# Altium project Knob-PCB-v1.0.PrjPcb (part 1 of 2)
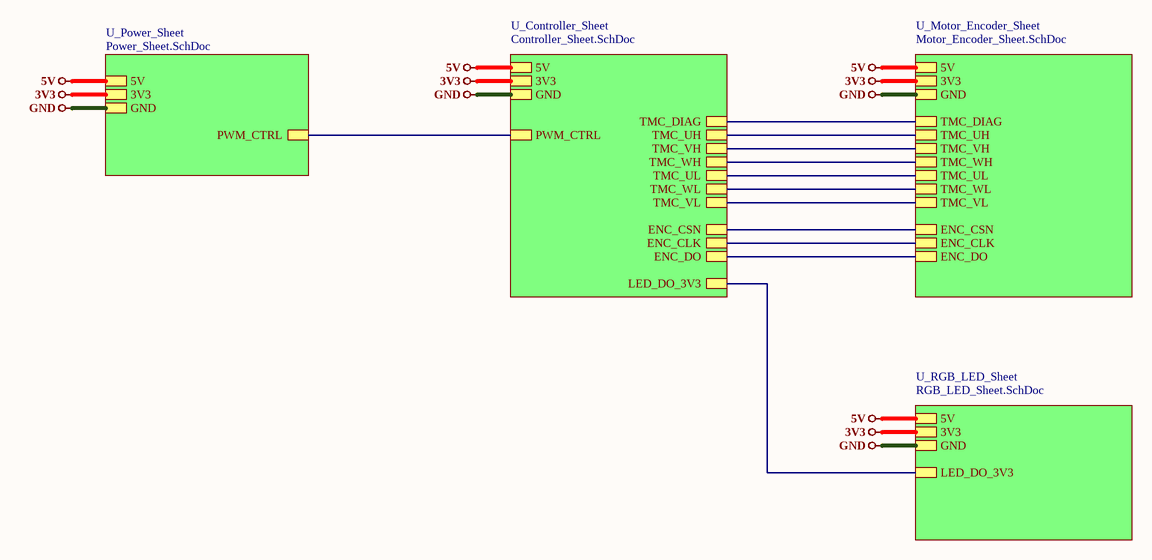
[diagram p0: Top_Sheet.SchDoc]
5 sheets, 109 parts. Net scope: hierarchical (ports join the sheet entries above them; power ports are global).
Board file: Knob-v1.0.PcbDoc
Sheets:
  Top_Sheet.SchDoc
    U_Controller_Sheet = Controller_Sheet.SchDoc
    U_Power_Sheet = Power_Sheet.SchDoc
    U_Motor_Encoder_Sheet = Motor_Encoder_Sheet.SchDoc
    U_RGB_LED_Sheet = RGB_LED_Sheet.SchDoc

## Sheet Top_Sheet.SchDoc
size 420 x 297 mm; SheetNumber: 1; SheetTotal: 5

### Sub-sheets
U_Controller_Sheet = Controller_Sheet.SchDoc: 3V3, GND, 5V, TMC_UH, TMC_VH, TMC_WH, TMC_UL, TMC_WL, TMC_VL, ENC_CSN, ENC_CLK, ENC_DO, TMC_DIAG, PWM_CTRL, LED_DO_3V3
U_Motor_Encoder_Sheet = Motor_Encoder_Sheet.SchDoc: 3V3, GND, 5V, TMC_UH, TMC_VH, TMC_WH, TMC_UL, TMC_WL, TMC_VL, ENC_CSN, ENC_CLK, ENC_DO, TMC_DIAG
U_Power_Sheet = Power_Sheet.SchDoc: 3V3, GND, 5V, PWM_CTRL
U_RGB_LED_Sheet = RGB_LED_Sheet.SchDoc: 3V3, GND, 5V, LED_DO_3V3

### Nets
3V3: sheet U_Controller_Sheet/3V3, sheet U_Power_Sheet/3V3, sheet U_Motor_Encoder_Sheet/3V3, sheet U_RGB_LED_Sheet/3V3
5V: sheet U_Controller_Sheet/5V, sheet U_Power_Sheet/5V, sheet U_Motor_Encoder_Sheet/5V, sheet U_RGB_LED_Sheet/5V
GND: sheet U_Controller_Sheet/GND, sheet U_Power_Sheet/GND, sheet U_Motor_Encoder_Sheet/GND, sheet U_RGB_LED_Sheet/GND
ENC_CLK: sheet U_Controller_Sheet/ENC_CLK, sheet U_Motor_Encoder_Sheet/ENC_CLK
ENC_CSN: sheet U_Controller_Sheet/ENC_CSN, sheet U_Motor_Encoder_Sheet/ENC_CSN
ENC_DO: sheet U_Controller_Sheet/ENC_DO, sheet U_Motor_Encoder_Sheet/ENC_DO
LED_DO_3V3: sheet U_Controller_Sheet/LED_DO_3V3, sheet U_RGB_LED_Sheet/LED_DO_3V3
PWM_CTRL: sheet U_Controller_Sheet/PWM_CTRL, sheet U_Power_Sheet/PWM_CTRL
TMC_DIAG: sheet U_Controller_Sheet/TMC_DIAG, sheet U_Motor_Encoder_Sheet/TMC_DIAG
TMC_UH: sheet U_Controller_Sheet/TMC_UH, sheet U_Motor_Encoder_Sheet/TMC_UH
TMC_UL: sheet U_Controller_Sheet/TMC_UL, sheet U_Motor_Encoder_Sheet/TMC_UL
TMC_VH: sheet U_Controller_Sheet/TMC_VH, sheet U_Motor_Encoder_Sheet/TMC_VH
TMC_VL: sheet U_Controller_Sheet/TMC_VL, sheet U_Motor_Encoder_Sheet/TMC_VL
TMC_WH: sheet U_Controller_Sheet/TMC_WH, sheet U_Motor_Encoder_Sheet/TMC_WH
TMC_WL: sheet U_Controller_Sheet/TMC_WL, sheet U_Motor_Encoder_Sheet/TMC_WL

### Notes on the sheet
- File:
- Title:
- Date:
- Page
- Num:
- Total:
- Drawn By: Huzaifa Ali

## Sheet Controller_Sheet.SchDoc
size 420 x 297 mm; SheetNumber: 3; SheetTotal: 5
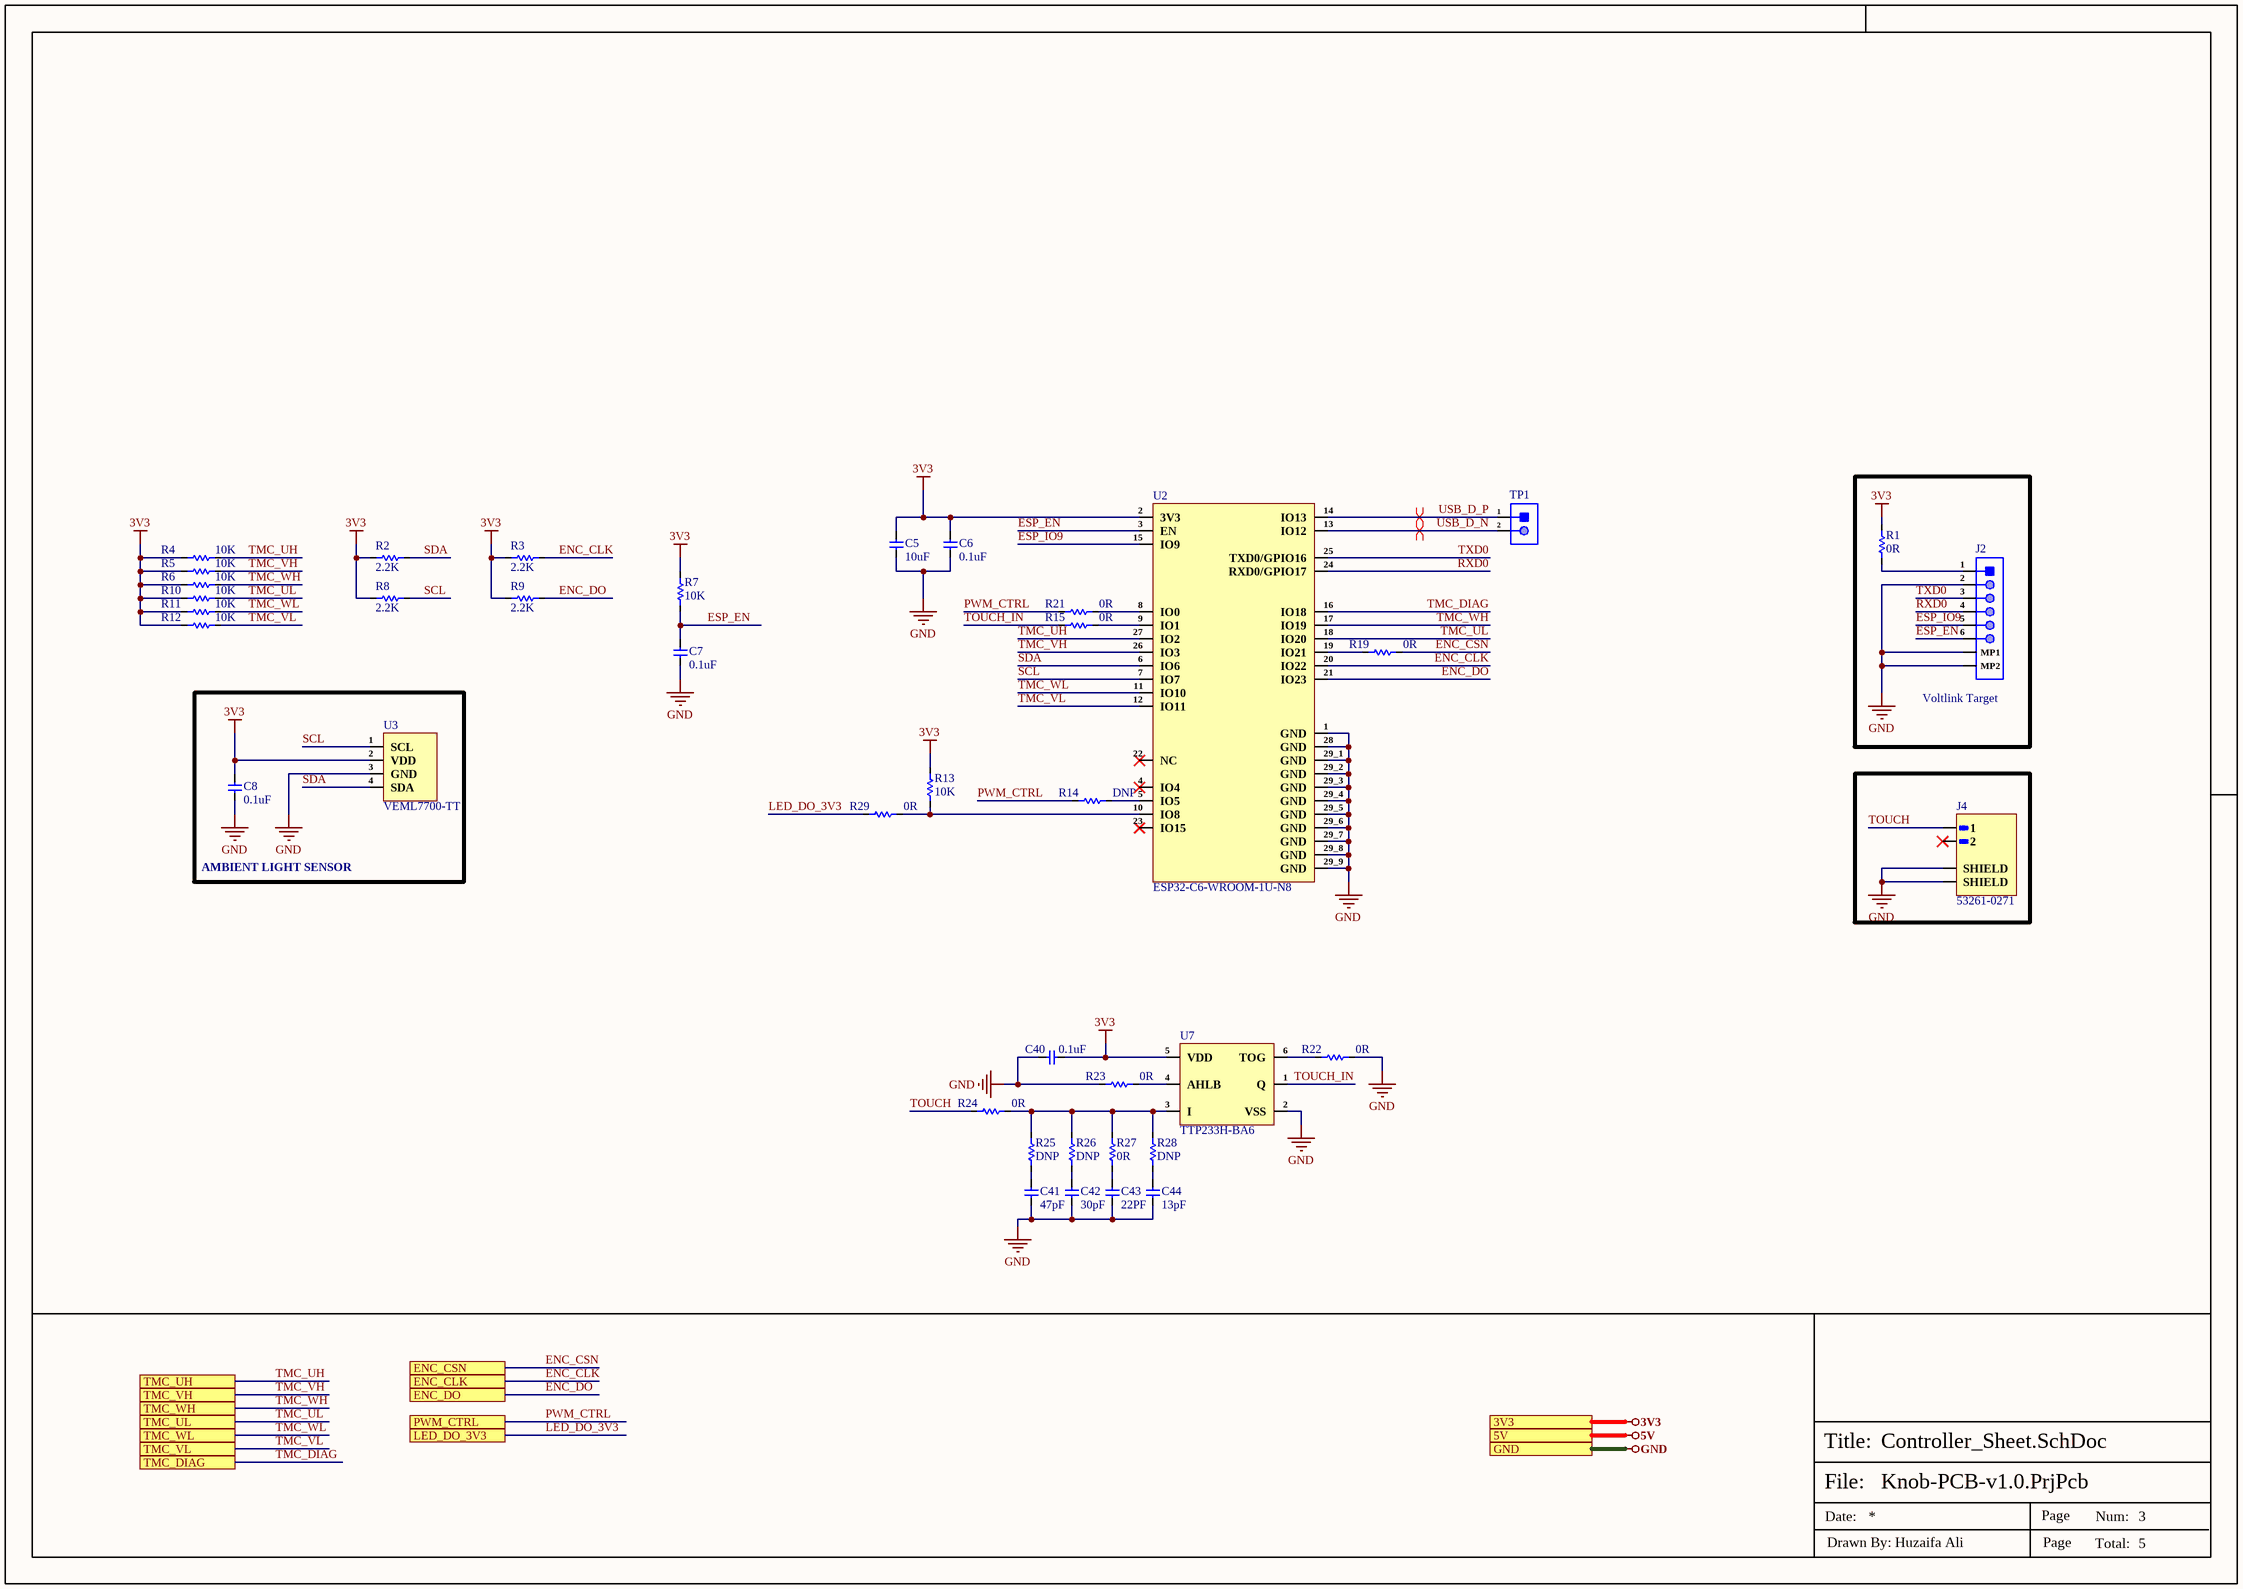
[diagram p1: Controller_Sheet.SchDoc]

### Parts
C5  10uF  [Cap-0805]
C6  0.1uF  [Cap-0402]
C7  0.1uF  [Cap-0402]
C8  0.1uF  [Cap-0402]
C40  0.1uF  [Cap-0402]
C41  47pF  [Cap-0402]
C42  30pF  [Cap-0402]
C43  22PF  [Cap-0402]
C44  13pF  [Cap-0402]
J2  Voltlink Target  [Voltlink Target]
J4  53261-0271  [0532610271]
R1  0R  [Res-0603]
R2  2.2K  [Res-0603]
R3  2.2K  [Res-0603]
R4  10K  [Res-0402]
R5  10K  [Res-0402]
R6  10K  [Res-0402]
R7  10K  [Res-0402]
R8  2.2K  [Res-0603]
R9  2.2K  [Res-0603]
R10  10K  [Res-0402]
R11  10K  [Res-0402]
R12  10K  [Res-0402]
R13  10K  [Res-0402]
R14  DNP  [Res-0603]
R15  0R  [Res-0603]
R19  0R  [Res-0603]
R21  0R  [Res-0603]
R22  0R  [Res-0603]
R23  0R  [Res-0603]
R24  0R  [Res-0603]
R25  DNP  [Res-0603]  (no BOM)
R26  DNP  [Res-0603]  (no BOM)
R27  0R  [Res-0603]
R28  DNP  [Res-0603]  (no BOM)
R29  0R  [Res-0603]
TP1  2 Test Pad  [2 Test Pad]  (value not drawn)  (no BOM)
U2  ESP32-C6-WROOM-1U-N8  [ESP32-C6-WROOM-1U-N8]
U3  VEML7700-TT  [VEML7700-TT]
U7  TTP233H-BA6  [SOT-23-6]

### Blocks framed on the sheet
AMBIENT LIGHT SENSOR: C8 U3

### Ports
3V3 (see Top_Sheet[3B], Motor_Encoder_Sheet[4D], Power_Sheet[3D], RGB_LED_Sheet[4D]), 5V (see Top_Sheet[3B], Motor_Encoder_Sheet[4D], Power_Sheet[3D], RGB_LED_Sheet[4D]), ENC_CLK (see Top_Sheet[4C], Motor_Encoder_Sheet[2D]), ENC_CSN (see Top_Sheet[4C], Motor_Encoder_Sheet[2D]), ENC_DO (see Top_Sheet[4C], Motor_Encoder_Sheet[2D]), GND (see Top_Sheet[3B], Motor_Encoder_Sheet[4D], Power_Sheet[3D], RGB_LED_Sheet[4D]), LED_DO_3V3 (see Top_Sheet[4C], RGB_LED_Sheet[1D]), PWM_CTRL (see Top_Sheet[3B], Power_Sheet[1D]), TMC_DIAG (see Top_Sheet[4B], Motor_Encoder_Sheet[1D]), TMC_UH (see Top_Sheet[4B], Motor_Encoder_Sheet[1D]), TMC_UL (see Top_Sheet[4C], Motor_Encoder_Sheet[1D]), TMC_VH (see Top_Sheet[4B], Motor_Encoder_Sheet[1D]), TMC_VL (see Top_Sheet[4C], Motor_Encoder_Sheet[1D]), TMC_WH (see Top_Sheet[4C], Motor_Encoder_Sheet[1D]), TMC_WL (see Top_Sheet[4C], Motor_Encoder_Sheet[1D])

### Nets
3V3: C5.2 C6.2 C8.2 C40.1 R1.2 R2.2 R3.2 R4.1 R5.1 R6.1 R7.2 R8.2 R9.2 R10.1 R11.1 R12.1 R13.2 U2.2(3V3) U3.2(VDD) U7.5(VDD) ; port 3V3
GND: C5.1 C6.1 C7.1 C8.1 C40.2 C41.1 C42.1 C43.1 C44.1 J2.2 J2.MP1 J2.MP2 J4.SH1(SHIELD) J4.SH2(SHIELD) R22.2 R23.1 U2.1(GND) U2.28(GND) U2.29_1(GND) U2.29_2(GND) U2.29_3(GND) U2.29_4(GND) U2.29_5(GND) U2.29_6(GND) U2.29_7(GND) U2.29_8(GND) U2.29_9(GND) U3.3(GND) U7.2(VSS) ; port GND
ENC_CLK: R3.1 U2.20(IO22) ; port ENC_CLK
ENC_CSN: R19.2 ; port ENC_CSN
ENC_DO: R9.1 U2.21(IO23) ; port ENC_DO
ESP_EN: C7.2 J2.6 R7.1 U2.3(EN)
ESP_IO9: J2.5 U2.15(IO9)
LED_DO_3V3: R29.1 ; port LED_DO_3V3
PWM_CTRL: R14.1 R21.1 ; port PWM_CTRL
RXD0: J2.4 U2.24(RXD0/GPIO17)
SCL: R8.1 U2.7(IO7) U3.1(SCL)
SDA: R2.1 U2.6(IO6) U3.4(SDA)
TMC_DIAG: U2.16(IO18) ; port TMC_DIAG
TMC_UH: R4.2 U2.27(IO2) ; port TMC_UH
TMC_UL: R10.2 U2.18(IO20) ; port TMC_UL
TMC_VH: R5.2 U2.26(IO3) ; port TMC_VH
TMC_VL: R12.2 U2.12(IO11) ; port TMC_VL
TMC_WH: R6.2 U2.17(IO19) ; port TMC_WH
TMC_WL: R11.2 U2.11(IO10) ; port TMC_WL
TOUCH: J4.1 R24.1
TOUCH_IN: R15.1 U7.1(Q)
TXD0: J2.3 U2.25(TXD0/GPIO16)
USB_D_N: TP1.2 U2.13(IO12)
USB_D_P: TP1.1 U2.14(IO13)
NetC41_2: C41.2 R25.1
NetC42_2: C42.2 R26.1
NetC43_2: C43.2 R27.1
NetC44_2: C44.2 R28.1
NetJ2_1: J2.1 R1.1
NetR13_1: R13.1 R29.2 U2.10(IO8)
NetR14_2: R14.2 U2.5(IO5)
NetR15_2: R15.2 U2.9(IO1)
NetR19_1: R19.1 U2.19(IO21)
NetR21_2: R21.2 U2.8(IO0)
NetR22_1: R22.1 U7.6(TOG)
NetR23_2: R23.2 U7.4(AHLB)
NetR24_2: R24.2 R25.2 R26.2 R27.2 R28.2 U7.3(I)

Not connected (* = marked no-connect by the designer): J4 2*; U2 4(IO4)* 22(NC)* 23(IO15)*

### Layout directives
differential pair: USB_D_N, USB_D_P

### Notes on the sheet
- File:
- Title:
- Date:
- Page
- Num:
- Total:
- Drawn By: Huzaifa Ali

### Library data of the parts
C5 = GRM21BZ71E106KE15L: CAP CER 10UF 25V X7R 0805; Manufacturer: Murata; Item Type: Capacitors; Material: 4241ConductorMaterial; Tolerance: 10%; Supplier: Mouser; LCSC Part Number: C237493; Manufacturer Part Number: GRM21BZ71E106KE15L; RoHS: Yes; Stock: 43117; Pricing: 1=0.34, 10=0.142, 50=0.142, 100=0.096, 1000=0.086, 10000=0.058 (USD); Case/Package: 339Case; Min Operating Temperature: -55°C; Max Operating Temperature: 125°C; Value: 10uF; Voltage Rating: 25V; Length: 2mm; Width: 1.25mm; Height: 1.45mm; Thickness: 1.25mm; RoHS Compliant: Yes
C6 C8 C40 = GRM155R71E104KE14D: CAP CER 0.1UF 25V X7R 0402; Manufacturer: Murata; Item Type: Capacitors; Dielectric Material: Ceramic; Material: 4241ConductorMaterial; Value: 100nF; Tolerance: 10%; Supplier: Mouser; LCSC Part Number: C77014; Manufacturer Part Number: GRM155R71E104KE14D; RoHS: Yes; Stock: 652368; Pricing: 1=0.1, 10=0.007, 50=0.007, 100=0.005, 1000=0.005, 10000=0.004 (USD); Mounting Technology: Surface Mount; Case/Package: 0402; Pins: 2NUMBER; Case Code (Metric): 1005; Case Code (Imperial): 0402; Weight: 0.000212oz; Min Operating Temperature: -55°C; Max Operating Temperature: 125°C; Packaging: Tape and Reel; Voltage Rating: 25V; Dielectric: X7R; Voltage: 25V; Termination: SMD/SMT; Voltage Rating (DC): 25V; Package Quantity: 10000; Series: GRM; Length: 1mm; Width: 0.02inch; Height: 0.5mm; Thickness: 0.022inch; Depth: 0.5mm; RoHS Compliant: Yes; Reach SVHC Compliant: Unknown; Lead Free: 5697LeadFree; ComponentLink1URL: http://www.farnell.com/datasheets/1872206.pdf?src-supplier=Farnell; ComponentLink1Description: http://www.farnell.com/datasheets/1872206.pdf?src-supplier=Farnell; ComponentLink2URL: http://www.mouser.com/ds/2/281/c02e-2905.pdf?src-supplier=Mouser; ComponentLink2Description: http://www.mouser.com/ds/2/281/c02e-2905.pdf?src-supplier=Mouser; ComponentLink3URL: http://uk.rs-online.com/webdocs/144c/0900766b8144c113.pdf?src-supplier=Rs; ComponentLink3Description: http://uk.rs-online.com/webdocs/144c/0900766b8144c113.pdf?src-supplier=Rs; ComponentLink4URL: https://datasheet.octopart.com/GRM155R71E104KE14D-Murata-datasheet-62346597.pdf?src-supplier=Future+Electronics; ComponentLink4Description: https://datasheet.octopart.com/GRM155R71E104KE14D-Murata-datasheet-62346597.pdf?src-supplier=Future+Electronics; ComponentLink5URL: https://search.murata.co.jp/Ceramy/image/img/A01X/G101/ENG/GRM155R71E104KE14-01.pdf?src-supplier=Digikey; ComponentLink5Description: https://search.murata.co.jp/Ceramy/image/img/A01X/G101/ENG/GRM155R71E104KE14-01.pdf?src-supplier=Digikey; ComponentLink6URL: http://www.farnell.com/datasheets/2048008.pdf?src-supplier=Newark; ComponentLink6Description: http://www.farnell.com/datasheets/2048008.pdf?src-supplier=Newark; ComponentLink7URL: https://datasheet.octopart.com/GRM155R71E104KE14D-Murata-datasheet-62317124.pdf?src-supplier=Element14; ComponentLink7Description: https://datasheet.octopart.com/GRM155R71E104KE14D-Murata-datasheet-62317124.pdf?src-supplier=Element14; ComponentLink8URL: http://psearch.en.murata.com/capacitor/product/GRM155R71E104KE14%23.pdf?src-supplier=Avnet; ComponentLink8Description: http://psearch.en.murata.com/capacitor/product/GRM155R71E104KE14%23.pdf?src-supplier=Avnet
C7 = GRM155R71C104KA88D: CAP CER 0.1UF 16V X7R 0402; Manufacturer: Murata; Material: Ceramic; Value: 100nF; Tolerance: 10%; Insulation Resistance: 10GR; Item Type: Capacitor; Supplier 1: Arrow Electronics; Manufacturer Part Number: GRM155R71C104KA88D; RoHS: Yes; Category: Ceramic Capacitors; Stock 1: 1690322; Pricing 1: 10000=0.00480, 30000=0.00470, 100000=0.00350, 250000=0.00330 (USD); Mounting Technology: Surface Mount; Case/Package: 0402; Pins: 2; Case Code (Metric): 1005; Case Code (Imperial): 0402; Dielectric Material: Ceramic; Min Operating Temperature: -55°C; Max Operating Temperature: 125°C; Voltage Rating: 16V; Packaging: Tape and Reel; Voltage Rating (DC): 16V; Package Quantity: 1; Dielectric: X7R; Termination: SMD/SMT; Voltage: 16V; Series: GRM; Length: 1mm; Width: 0.02inch; Height: 0.5mm; Thickness: 0.022inch; Depth: 0.5mm; Radiation Hardening: No; Lead Free: Lead Free; RoHS Compliant: Yes; ComponentLink1URL: https://datasheet.ciiva.com/129/grm155r71c104ka88-01-129739.pdf?src-supplier=Digi-Key; ComponentLink1Description: https://datasheet.ciiva.com/129/grm155r71c104ka88-01-129739.pdf?src-supplier=Digi-Key; ComponentLink2URL: https://datasheet.ciiva.com/129/grm155r71c104ka88-01-129740.pdf?src-supplier=Digi-Key; ComponentLink2Description: https://datasheet.ciiva.com/129/grm155r71c104ka88-01-129740.pdf?src-supplier=Digi-Key; ComponentLink3URL: https://datasheet.ciiva.com/18102/getdatasheetpartid-85307-18102905.pdf?src-supplier=Verical; ComponentLink3Description: https://datasheet.ciiva.com/18102/getdatasheetpartid-85307-18102905.pdf?src-supplier=Verical; ComponentLink4URL: https://datasheet.ciiva.com/29199/454098-da-01-en-vs-kondensator-0402-29199799.pdf?src-supplier=Conrad; ComponentLink4Description: https://datasheet.ciiva.com/29199/454098-da-01-en-vs-kondensator-0402-29199799.pdf?src-supplier=Conrad; ComponentLink5URL: https://datasheet.ciiva.com/7937/4360-7937615.pdf?src-supplier=Element14; ComponentLink5Description: https://datasheet.ciiva.com/7937/4360-7937615.pdf?src-supplier=Element14; ComponentLink6URL: https://datasheet.ciiva.com/14116/grmseries-highdielectrictype-eng-14116878.pdf?src-supplier=Distrelec; ComponentLink6Description: https://datasheet.ciiva.com/14116/grmseries-highdielectrictype-eng-14116878.pdf?src-supplier=Distrelec; ComponentLink7URL: https://datasheet.ciiva.com/14103/grmseries-highdielectrictype-eng-14103750.pdf?src-supplier=Distrelec; ComponentLink7Description: https://datasheet.ciiva.com/14103/grmseries-highdielectrictype-eng-14103750.pdf?src-supplier=Distrelec; ComponentLink8URL: https://datasheet.ciiva.com/28534/4360-28534127.pdf?src-supplier=Element14; ComponentLink8Description: https://datasheet.ciiva.com/28534/4360-28534127.pdf?src-supplier=Element14; ComponentLink9URL: https://datasheet.ciiva.com/28534/4360-28534133.pdf?src-supplier=Element14; ComponentLink9Description: https://datasheet.ciiva.com/28534/4360-28534133.pdf?src-supplier=Element14; ComponentLink10URL: https://datasheet.ciiva.com/16199/product-16199000.pdf?src-supplier=Future+Electronics; ComponentLink10Description: https://datasheet.ciiva.com/16199/product-16199000.pdf?src-supplier=Future+Electronics; Supplier Part Number 1: GRM155R71C104KA88D; LCSC Part Number: C71629
C41 = GCM1555C1H470FA16D: CAP CER 47PF 50V C0G/NP0 0402; Manufacturer: Murata; Tolerance: 1%; Supplier 1: Digi-Key; Manufacturer Part Number: GCM1555C1H470FA16D; RoHS: No; Category: Ceramic Capacitors; Stock 1: 27098; Pricing 1: 1=0.11000, 10=0.07900, 50=0.04500, 100=0.03730, 500=0.02618, 1000=0.02168, 2500=0.02018, 5000=0.01846 (USD); Mount: Surface Mount; Case/Package: 0402; Case Code (Imperial): 0402; Case Code (Metric): 1005; Min Operating Temperature: -55°C; Max Operating Temperature: 125°C; Packaging: Tape and Reel; Capacitance: 47pF; Voltage Rating: 50V; Ratings: AEC-Q200; ComponentLink1URL: http://search.murata.co.jp/Ceramy/image/img/A01X/G101/ENG/GCM1555C1H470FA16-01.pdf?src-supplier=Digi-Key; ComponentLink1Description: http://search.murata.co.jp/Ceramy/image/img/A01X/G101/ENG/GCM1555C1H470FA16-01.pdf?src-supplier=Digi-Key; Supplier Part Number 1: 490-16445-1-ND; LCSC Part Number: C393684
C42 = CC0402JRNPO9BN300: CAP CER 30PF 50V C0G/NPO 0402; Manufacturer: Yageo; Temperature Coefficient: 30ppm/°C; Item Type: Capacitor; Supplier 1: Future Electronics; Manufacturer Part Number: CC0402JRNPO9BN300; RoHS: Yes; Category: Ceramic Capacitors; Stock 1: 540000; Pricing 1: 10000=0.0025, 40000=0.0024, 150000=0.0023, 400000=0.0022, 1000000=0.0021 (USD); Halogen Free: 5694HalogenFree; ComponentLink1URL: https://datasheet.ciiva.com/13263/upy-gp-np0-16v-to-50v-8-3714-13263961.pdf?src-supplier=Mouser; ComponentLink1Description: https://datasheet.ciiva.com/13263/upy-gp-np0-16v-to-50v-8-3714-13263961.pdf?src-supplier=Mouser; Supplier Part Number 1: 6784771
C43 = CC0402JRNPO9BN220: CAP CER 22PF 50V C0G/NPO 0402; Manufacturer: Yageo; Dielectric Material: Ceramic; Tolerance: 5%; Dielectric: C0G; Temperature Coefficient: 30ppm/°C; Insulation Resistance: 100GR; Item Type: Capacitor; Supplier 1: Future Electronics; Manufacturer Part Number: CC0402JRNPO9BN220; RoHS: Yes; Category: Ceramic Capacitors; Stock 1: 200000; Pricing 1: 10000=0.00220, 40000=0.00210, 150000=0.00200, 400000=0.00190, 1000000=0.00180 (USD); Mounting Technology: Surface Mount; Case/Package: 0402; Pins: 2; Case Code (Metric): 1005; Case Code (Imperial): 0402; Min Operating Temperature: -55°C; Max Operating Temperature: 125°C; Value: 22pF; Voltage Rating: 50V; Packaging: Tape and Reel; Package Quantity: 1; Voltage Rating (DC): 50V; Termination: SMD/SMT; Resistor Type: Ceramic; Voltage: 50V; Series: CC; Length: 1mm; Width: 0.02inch; Height: 0.5mm; Thickness: 0.022inch; Depth: 0.5mm; Radiation Hardening: No; Reach SVHC Compliant: Yes; Lead Free: Lead Free; RoHS Compliant: Yes; ComponentLink1URL: https://datasheet.ciiva.com/5789/1443161-5789509.pdf?src-supplier=Farnell; ComponentLink1Description: https://datasheet.ciiva.com/5789/1443161-5789509.pdf?src-supplier=Farnell; ComponentLink2URL: https://datasheet.ciiva.com/8033/1443161-8033606.pdf?src-supplier=Element14; ComponentLink2Description: https://datasheet.ciiva.com/8033/1443161-8033606.pdf?src-supplier=Element14; ComponentLink3URL: https://datasheet.ciiva.com/7656/1132289-7656615.pdf?src-supplier=Element14; ComponentLink3Description: https://datasheet.ciiva.com/7656/1132289-7656615.pdf?src-supplier=Element14; ComponentLink4URL: https://datasheet.ciiva.com/8033/1443161-8033607.pdf?src-supplier=Element14; ComponentLink4Description: https://datasheet.ciiva.com/8033/1443161-8033607.pdf?src-supplier=Element14; ComponentLink5URL: https://datasheet.ciiva.com/8033/1443161-8033605.pdf?src-supplier=Element14; ComponentLink5Description: https://datasheet.ciiva.com/8033/1443161-8033605.pdf?src-supplier=Element14; ComponentLink6URL: https://datasheet.ciiva.com/143/mlccorderingcode-143987.pdf?src-supplier=Digi-Key; ComponentLink6Description: https://datasheet.ciiva.com/143/mlccorderingcode-143987.pdf?src-supplier=Digi-Key; ComponentLink7URL: https://datasheet.ciiva.com/143/mlccorderingcode-143986.pdf?src-supplier=Digi-Key; ComponentLink7Description: https://datasheet.ciiva.com/143/mlccorderingcode-143986.pdf?src-supplier=Digi-Key; ComponentLink8URL: https://datasheet.ciiva.com/143/mlccorderingcode-143988.pdf?src-supplier=Digi-Key; ComponentLink8Description: https://datasheet.ciiva.com/143/mlccorderingcode-143988.pdf?src-supplier=Digi-Key; ComponentLink9URL: https://datasheet.ciiva.com/5425/upy-gp-np0-16v-to-50v-8-5425483.pdf?src-supplier=Mouser; ComponentLink9Description: https://datasheet.ciiva.com/5425/upy-gp-np0-16v-to-50v-8-5425483.pdf?src-supplier=Mouser; ComponentLink10URL: https://datasheet.ciiva.com/15189/getdatasheetpartid-370074-15189117.pdf?src-supplier=Verical; ComponentLink10Description: https://datasheet.ciiva.com/15189/getdatasheetpartid-370074-15189117.pdf?src-supplier=Verical; Supplier Part Number 1: 9105957; LCSC Part Number: C106203
C44 = CC0402FRNPO9BN130: CAP CER 13PF 50V C0G/NP0 0402; Manufacturer: Yageo; Item Type: Capacitors; Supplier: Digikey; LCSC Part Number: C541433; Manufacturer Part Number: CC0402FRNPO9BN130; RoHS: No; Pricing: 10000=0.00937 (USD)
J2 = C145963: 1x6P SH 1 1mm 6 SMD,P=1mm Wire To Board / Wire To Wire Connector ROHS; Manufacturer: BOOMELE; Manufacturer Part Number: C145963; Package: SMD,P=1mm; LCSC Part Number: C145963; Item Type: Connector; ComponentLink1Description: LCSC; ComponentLink1URL: https://www.lcsc.com/product-detail/Wire-To-Board-Wire-To-Wire-Connector_BOOMELE-Boom-Precision-Elec-C145963_C145963.html
J4 = 53261-0271: CONN HEADER SMD R/A 2POS 1.25MM; Manufacturer: Molex; Item Type: Headers and Wire Housings; Plating: Tin; Contact Resistance: 20mR; Number of Contacts: 2; Voltage Rating: 125V; Current Rating: 1A; Insulation Resistance: 100MR; Gender: Male; Glow Wire Compliant: Non-compliant; Supplier: Arrow Electronics; LCSC Part Number: C177225; Manufacturer Part Number: 53261-0271; RoHS: Yes; Stock: 107200; Pricing: 1000=0.4221, 2000=0.4184, 3000=0.4147, 4000=0.411, 5000=0.4073, 10000=0.4035 (USD); Mounting Technology: Surface Mount; Contact Material: Bronze,Tin; Contact Plating: Tin; Color: Beige; Housing Material: Nylon; Contact Shape: Rectangular; Contact Finish - Mating: TIN; Insulation Material: Nylon; Insulation Color: Natural; Housing Color: Natural; Min Operating Temperature: -40°C; Max Operating Temperature: 85°C; Termination: Solder; Orientation: Right Angle; Number of Rows: 1; Voltage Rating (AC): 125V; Package Quantity: 1000; Packaging: Tape and Reel; Number of Positions: 2; Working Voltage: 125V; Number of Circuits: 2; Voltage Rating (DC): 125V; Connector Type: Header; Fastening Type: Detent; Series: PicoBlade; Contact Type: Blade Pin; Pitch: 1.25mm; Lead Pitch: 1.25mm; Depth: 5.2mm; Radiation Hardening: No; Lead Free: Lead Free; Flammability Rating: UL94 V-0; RoHS Compliant: Yes; Reach SVHC Compliant: Unknown; ComponentLink1URL: https://datasheet.ciiva.com/7167/1626147-7167496.pdf?src-supplier=Newark; ComponentLink1Description: https://datasheet.ciiva.com/7167/1626147-7167496.pdf?src-supplier=Newark; ComponentLink2URL: https://datasheet.ciiva.com/34303/1932547-34303342.pdf?src-supplier=Jameco; ComponentLink2Description: https://datasheet.ciiva.com/34303/1932547-34303342.pdf?src-supplier=Jameco; ComponentLink3URL: https://datasheet.ciiva.com/7920/1887027-7920826.pdf?src-supplier=Element14; ComponentLink3Description: https://datasheet.ciiva.com/7920/1887027-7920826.pdf?src-supplier=Element14; ComponentLink4URL: https://datasheet.ciiva.com/22683/1626147-22683562.pdf?src-supplier=Element14; ComponentLink4Description: https://datasheet.ciiva.com/22683/1626147-22683562.pdf?src-supplier=Element14; ComponentLink5URL: https://datasheet.ciiva.com/46393/1808526-46393547.pdf?src-supplier=Element14; ComponentLink5Description: https://datasheet.ciiva.com/46393/1808526-46393547.pdf?src-supplier=Element14
R1 R14 R15 R19 R21-R29 = RC0603JR-070RL: RES 0 OHM JUMPER 1/10W 0603; Manufacturer: Yageo; Resistance: 0mR; Tolerance: 1%; Power Rating: 100mW; Voltage Rating (DC): 50V; Temperature Coefficient: 200ppm/°C; Resistance Tolerance: 5%; Item Type: Resistor; Supplier 1: Digi-Key; Manufacturer Part Number: RC0603JR-070RL; RoHS: Yes; Category: Chip SMD Resistors; Stock 1: 18081776; Pricing 1: 1=0.10000, 10=0.01700, 25=0.01240, 50=0.00960, 100=0.00700, 250=0.00536, 500=0.00430, 1000=0.00316 (USD); Case/Package: 0603; Number of Pins: 2; Contact Plating: Tin,Matte; Case Code (Imperial): 0603; Case Code (Metric): 1608; Size Code: 0603; Min Operating Temperature: -55°C; Max Operating Temperature: 155°C; Resistor Type: Thick Film; Packaging: Tape and Reel; Termination: SMD/SMT; Series: RC; Technology: THICK FILM; Package Quantity: 5000; Voltage Rating: 50V; Features: Moisture Resistant; Max Power Dissipation: 100mW; Number of Terminations: 2; Construction: Rectangular; Length: 1.6mm; Width: 0.8mm; Height: 0.45mm; Depth: 0.8mm; Radiation Hardening: No; Reach SVHC Compliant: No SVHC; Lead Free: Lead Free; RoHS Compliant: Yes; Military Standard: Not; Supplier Part Number 1: 311-0.0GRCT-ND; LCSC Part Number: C95177
R2 R3 R8 R9 = RC0603FR-072K2L: RES 2.2K OHM 1% 1/10W 0603; Manufacturer: Yageo; Resistance: 2.2kR; Temperature Coefficient: 100ppm/°C; Power Rating: 100mW; Voltage Rating: 50V; Item Type: Resistor; Supplier 1: Avnet; Manufacturer Part Number: RC0603FR-072K2L; RoHS: Yes; Category: Chip SMD Resistors; Stock 1: 733100; Pricing 1: 5000=0.00133, 10000=0.00131, 20000=0.00127 (USD); Case/Package: 0603; Case Code (Imperial): 0603; Case Code (Metric): 1608; Size Code: 0603; Min Operating Temperature: -55°C; Max Operating Temperature: 155°C; Tolerance: 1%; Packaging: Tape and Reel; Resistor Type: Thick Film; Package Quantity: 1; Termination: SMD/SMT; Number of Terminations: 2; Max Power Dissipation: 100mW; Features: Moisture Resistant; Series: RC; Resistance Tolerance: 1%; Construction: Rectangular; Length: 1.6mm; Width: 0.031inch; Height: 0.022inch; Depth: 0.8mm; Lead Free: Lead Free; Military Standard: Not; RoHS Compliant: Yes; Supplier Part Number 1: RC0603FR-072K2L; LCSC Part Number: C114662
R4-R7 R10-R13 = RC0402FR-0710KL: RES 10K OHM 1% 1/16W 0402; Manufacturer: Yageo; Resistance: 10kR; Voltage Rating (DC): 50V; Temperature Coefficient: 100ppm/°C; Power Rating: 62.5mW; Max Power Dissipation: 63mW; Item Type: Resistor; Supplier 1: Mouser; Manufacturer Part Number: RC0402FR-0710KL; RoHS: Yes; Category: Chip SMD Resistors; Stock 1: 18648329; Pricing 1: 1=0.10000, 10=0.01400, 50=0.01400, 100=0.00500, 1000=0.00300, 10000=0.00200 (USD); Case/Package: 0402; Number of Pins: 2; Case Code (Imperial): 0402; Case Code (Metric): 1005; Min Operating Temperature: -55°C; Max Operating Temperature: 155°C; Resistor Type: Thick Film; Tolerance: 1%; Packaging: Tape and Reel; Voltage Rating: 50V; Termination: SMD/SMT; Working Voltage: 50V; Number of Terminations: 2; Features: Moisture Resistant; Series: RC; Resistance Tolerance: 1%; Construction: Rectangular; Length: 1mm; Width: 0.5mm; Height: 0.32mm; Depth: 0.5mm; Lead Pitch: 0.2mm; REACH SVHC: No SVHC; Lead Free: Lead Free; RoHS Compliant: Yes; Military Standard: Not; ComponentLink1URL: https://datasheet.ciiva.com/7660/38568-7660787.pdf?src-supplier=Element14; ComponentLink1Description: https://datasheet.ciiva.com/7660/38568-7660787.pdf?src-supplier=Element14; ComponentLink2URL: https://datasheet.ciiva.com/7849/1686128-7849814.pdf?src-supplier=Element14; ComponentLink2Description: https://datasheet.ciiva.com/7849/1686128-7849814.pdf?src-supplier=Element14; ComponentLink3URL: https://datasheet.ciiva.com/7983/1018594-7983486.pdf?src-supplier=Element14; ComponentLink3Description: https://datasheet.ciiva.com/7983/1018594-7983486.pdf?src-supplier=Element14; ComponentLink4URL: https://datasheet.ciiva.com/22747/1018594-22747512.pdf?src-supplier=Element14; ComponentLink4Description: https://datasheet.ciiva.com/22747/1018594-22747512.pdf?src-supplier=Element14; ComponentLink5URL: https://datasheet.ciiva.com/12667/pyu-rc0402-51-rohs-l-6-r-12667067.pdf?src-supplier=Mouser; ComponentLink5Description: https://datasheet.ciiva.com/12667/pyu-rc0402-51-rohs-l-6-r-12667067.pdf?src-supplier=Mouser; ComponentLink6URL: https://datasheet.ciiva.com/7849/1784430-7849813.pdf?src-supplier=Element14; ComponentLink6Description: https://datasheet.ciiva.com/7849/1784430-7849813.pdf?src-supplier=Element14; ComponentLink7URL: https://datasheet.ciiva.com/7849/1784430-7849815.pdf?src-supplier=Element14; ComponentLink7Description: https://datasheet.ciiva.com/7849/1784430-7849815.pdf?src-supplier=Element14; Supplier Part Number 1: 603-RC0402FR-0710KL; LCSC Part Number: C60490
TP1 = 2 Test Pad: Wire Connecting Pad; Item Type: Test Point; Manufacturer Part Number: 2 Test Pad
U2 = ESP32-C6-WROOM-1U-N8: RF TXRX MOD BT WIFI PCB TH SMD; Manufacturer: Espressif Systems; Item Type: Module; Supplier: Digikey; Supplier Part Number: 1965-ESP32-C6-WROOM-1U-N8CT-ND; Manufacturer Part Number: ESP32-C6-WROOM-1U-N8; RoHS: No; Stock: 1394; Pricing: 1=5.43, 10=4.698, 25=4.444, 100=4.0954, 250=3.88644 (USD); ComponentLink1URL: https://datasheet.octopart.com/ESP32-C6-WROOM-1U-N8-Espressif-Systems-datasheet-188867345.pdf?src-supplier=TME; ComponentLink1Description: https://datasheet.octopart.com/ESP32-C6-WROOM-1U-N8-Espressif-Systems-datasheet-188867345.pdf?src-supplier=TME
U3 = VEML7700-TT: SENSOR OPT AMBIENT 4 SMD J LEAD; Manufacturer: Vishay Semiconductors; Item Type: Sensors; Min Supply Voltage (DC): 2.5V; Max Supply Voltage (DC): 3.6V; Output Current: 3mA; Supplier: Mouser; LCSC Part Number: C1850416; Manufacturer Part Number: VEML7700-TT; RoHS: Yes; Stock: 116827; Pricing: 1=1.85, 10=1.26, 50=1.26, 100=0.955, 1000=0.772, 10000=0.667 (USD); Mounting Technology: Surface Mount; Case/Package: SMD/SMT; Packaging: Tape and Reel; Series: *; Reach SVHC Compliant: No; RoHS Compliant: Yes; ComponentLink1URL: http://www.farnell.com/datasheets/2118175.pdf?_ga=2.74067602.1265931949.1503988629-1413671594.1503025027&src-supplier=Farnell; ComponentLink1Description: http://www.farnell.com/datasheets/2118175.pdf?_ga=2.74067602.1265931949.1503988629-1413671594.1503025027&src-supplier=Farnell; ComponentLink2URL: http://www.farnell.com/datasheets/2118175.pdf?src-supplier=Element14; ComponentLink2Description: http://www.farnell.com/datasheets/2118175.pdf?src-supplier=Element14; ComponentLink3URL: http://www.farnell.com/datasheets/2118175.pdf?_ga=2.74067602.1265931949.1503988629-1413671594.1503025027&src-supplier=Newark; ComponentLink3Description: http://www.farnell.com/datasheets/2118175.pdf?_ga=2.74067602.1265931949.1503988629-1413671594.1503025027&src-supplier=Newark; ComponentLink4URL: http://www.vishay.com/docs/84286/veml7700.pdf?src-supplier=Digikey; ComponentLink4Description: http://www.vishay.com/docs/84286/veml7700.pdf?src-supplier=Digikey
U7 = TTP233H-BA6: SOT-23-6L Touch Sensors ROHS; Manufacturer: Tontek Design Tech; Item Type: IC; Manufacturer Part Number: TTP233H-BA6; Package: SOT-23-6L; LCSC Part Number: C2890349; ComponentLink1Description: LCSC; ComponentLink1URL: https://www.lcsc.com/product-detail/Touch-Sensors_Tontek-Design-Tech-TTP233H-BA6_C2890349.html

## Sheet Power_Sheet.SchDoc
size A4; SheetNumber: 2; SheetTotal: 4
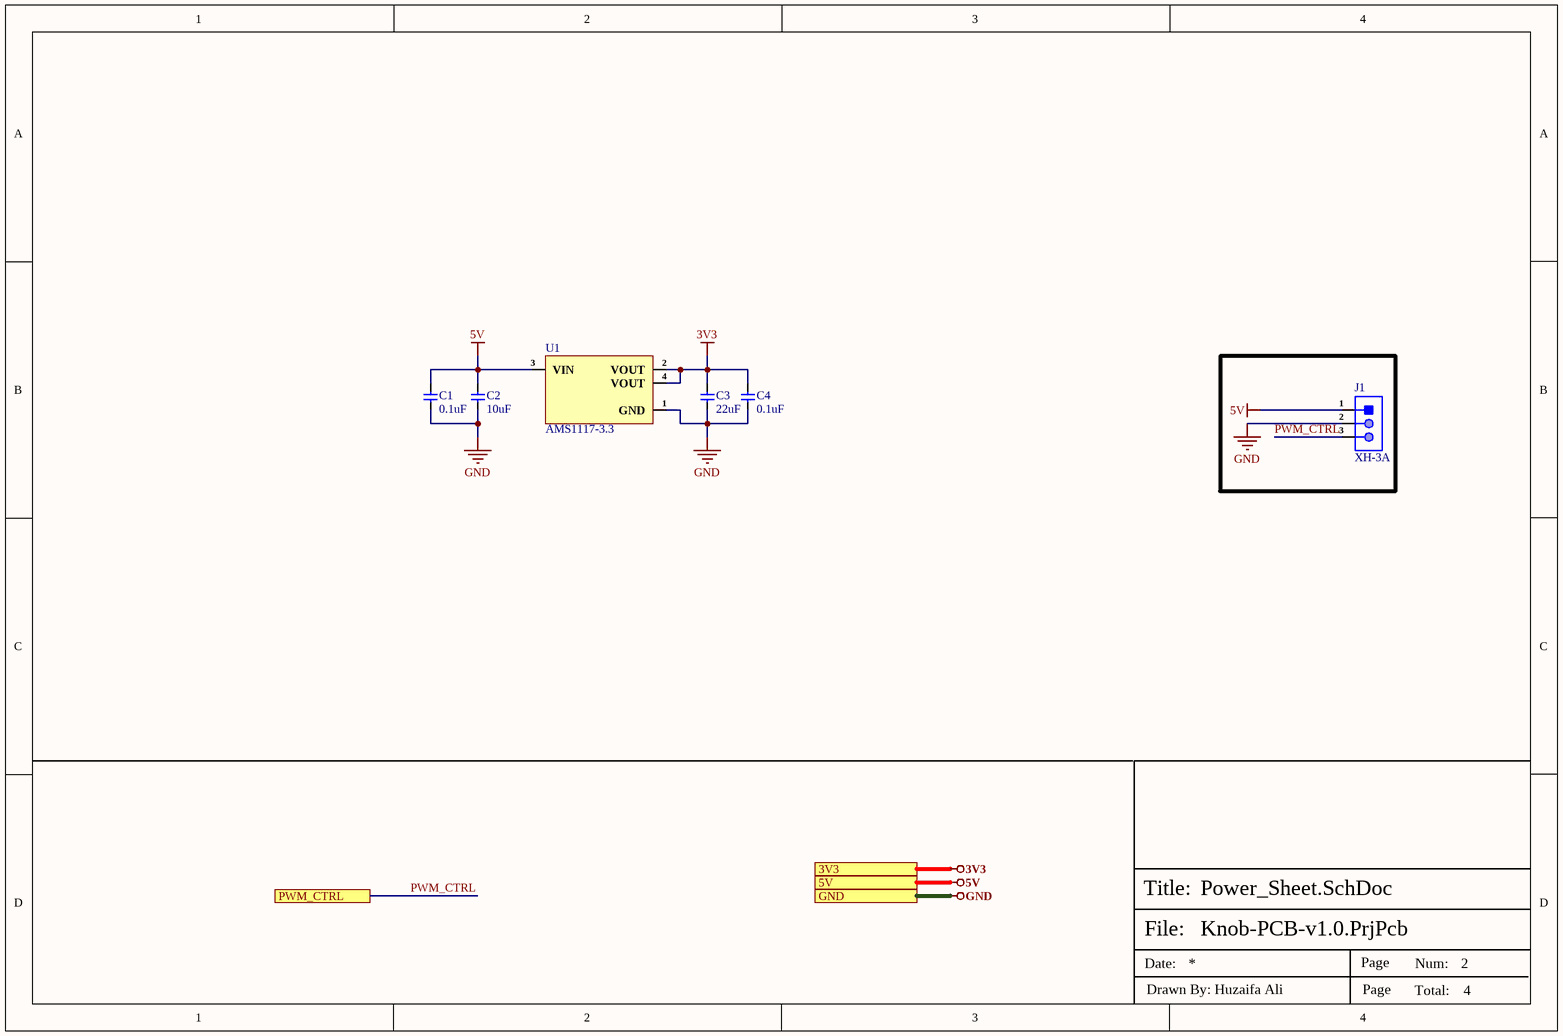
[diagram p2: Power_Sheet.SchDoc]

### Parts
C1  0.1uF  [Cap-0402]
C2  10uF  [Cap-0805]
C3  22uF  [Cap-0805]
C4  0.1uF  [Cap-0402]
J1  XH-3A  [XH-3A]
U1  AMS1117-3.3  [SOT- 223]

### Ports
3V3 (see Top_Sheet[2B], Controller_Sheet[4D], Motor_Encoder_Sheet[4D]), 5V (see Top_Sheet[2B], Controller_Sheet[4D], Motor_Encoder_Sheet[4D]), GND (see Top_Sheet[2B], Controller_Sheet[4D], Motor_Encoder_Sheet[4D]), PWM_CTRL (see Top_Sheet[3B], Controller_Sheet[2D])

### Nets
3V3: C3.2 C4.2 U1.2(VOUT) U1.4(VOUT) ; port 3V3
5V: C1.2 C2.2 J1.1 U1.3(VIN) ; port 5V
GND: C1.1 C2.1 C3.1 C4.1 J1.2 U1.1(GND) ; port GND
PWM_CTRL: J1.3 ; port PWM_CTRL

### Notes on the sheet
- File:
- Title:
- Date:
- Page
- Num:
- Total:
- Drawn By: Huzaifa Ali

### Library data of the parts
C1 C4 = GRM155R71E104KE14D: as C6 on sheet Controller_Sheet; Supplier: Mouser; LCSC Part Number: C77014; Manufacturer Part Number: GRM155R71E104KE14D; RoHS: Yes; Stock: 652368; Pricing: 1=0.1, 10=0.007, 50=0.007, 100=0.005, 1000=0.005, 10000=0.004 (USD); Mounting Technology: Surface Mount; Case/Package: 0402; Pins: 2NUMBER; Case Code (Metric): 1005; Case Code (Imperial): 0402; Weight: 0.000212oz; Min Operating Temperature: -55°C; Max Operating Temperature: 125°C; Packaging: Tape and Reel; Voltage Rating: 25V; Dielectric: X7R; Voltage: 25V; Termination: SMD/SMT; Voltage Rating (DC): 25V; Package Quantity: 10000; Series: GRM; Length: 1mm; Width: 0.02inch; Height: 0.5mm; Thickness: 0.022inch; Depth: 0.5mm; RoHS Compliant: Yes; Reach SVHC Compliant: Unknown; Lead Free: 5697LeadFree; ComponentLink1URL: http://www.farnell.com/datasheets/1872206.pdf?src-supplier=Farnell; ComponentLink1Description: http://www.farnell.com/datasheets/1872206.pdf?src-supplier=Farnell; ComponentLink2URL: http://www.mouser.com/ds/2/281/c02e-2905.pdf?src-supplier=Mouser; ComponentLink2Description: http://www.mouser.com/ds/2/281/c02e-2905.pdf?src-supplier=Mouser; ComponentLink3URL: http://uk.rs-online.com/webdocs/144c/0900766b8144c113.pdf?src-supplier=Rs; ComponentLink3Description: http://uk.rs-online.com/webdocs/144c/0900766b8144c113.pdf?src-supplier=Rs; ComponentLink4URL: https://datasheet.octopart.com/GRM155R71E104KE14D-Murata-datasheet-62346597.pdf?src-supplier=Future+Electronics; ComponentLink4Description: https://datasheet.octopart.com/GRM155R71E104KE14D-Murata-datasheet-62346597.pdf?src-supplier=Future+Electronics; ComponentLink5URL: https://search.murata.co.jp/Ceramy/image/img/A01X/G101/ENG/GRM155R71E104KE14-01.pdf?src-supplier=Digikey; ComponentLink5Description: https://search.murata.co.jp/Ceramy/image/img/A01X/G101/ENG/GRM155R71E104KE14-01.pdf?src-supplier=Digikey; ComponentLink6URL: http://www.farnell.com/datasheets/2048008.pdf?src-supplier=Newark; ComponentLink6Description: http://www.farnell.com/datasheets/2048008.pdf?src-supplier=Newark; ComponentLink7URL: https://datasheet.octopart.com/GRM155R71E104KE14D-Murata-datasheet-62317124.pdf?src-supplier=Element14; ComponentLink7Description: https://datasheet.octopart.com/GRM155R71E104KE14D-Murata-datasheet-62317124.pdf?src-supplier=Element14; ComponentLink8URL: http://psearch.en.murata.com/capacitor/product/GRM155R71E104KE14%23.pdf?src-supplier=Avnet; ComponentLink8Description: http://psearch.en.murata.com/capacitor/product/GRM155R71E104KE14%23.pdf?src-supplier=Avnet
C2 = GRM21BZ71E106KE15L: as C5 on sheet Controller_Sheet; Supplier: Mouser; LCSC Part Number: C237493; Manufacturer Part Number: GRM21BZ71E106KE15L; RoHS: Yes; Stock: 43117; Pricing: 1=0.34, 10=0.142, 50=0.142, 100=0.096, 1000=0.086, 10000=0.058 (USD); Case/Package: 339Case; Min Operating Temperature: -55°C; Max Operating Temperature: 125°C; Value: 10uF; Voltage Rating: 25V; Length: 2mm; Width: 1.25mm; Height: 1.45mm; Thickness: 1.25mm; RoHS Compliant: Yes
C3 = GRM21BZ71A226ME15L: CAP CER 22UF 10V X7R 0805; Manufacturer: Murata; Material: 4241ConductorMaterial; Tolerance: 20%; Item Type: Capacitor; Supplier: Digi-Key; Supplier Part Number: 490-GRM21BZ71A226ME15LCT-ND; Manufacturer Part Number: GRM21BZ71A226ME15L; RoHS: Yes; Category: Ceramic Capacitors; Stock: 49126; Pricing: 1=0.39, 10=0.259, 50=0.191, 100=0.1556, 500=0.12282, 1000=0.10372 (USD); Package: 0805; Min Operating Temperature: -55°C; Max Operating Temperature: 125°C; Value: 22uF; Voltage Rating: 10V; Length: 2mm; Width: 1.25mm; Height: 1.45mm; Thickness: 1.25mm; ComponentLink1URL: https://datasheet.octopart.com/GRM21BZ71A226ME15L-Murata-datasheet-165579666.pdf?src-supplier=TME; ComponentLink1Description: https://datasheet.octopart.com/GRM21BZ71A226ME15L-Murata-datasheet-165579666.pdf?src-supplier=TME; LCSC Part Number: C907991; ComponentLink2Description: LCSC; ComponentLink2URL: https://www.lcsc.com/product-detail/Multilayer-Ceramic-Capacitors-MLCC-SMD-SMT_Murata-Electronics-GRM21BZ71A226ME15L_C907991.html
J1 = XH-3A: 1x3P 3P XH 1 Tin 2.5mm 3 -25℃~+85℃ Brass 3A Straight Plugin,P=2.5mm Wire To Board Connector ROHS; Manufacturer: HCTL; Manufacturer Part Number: XH-3A; Package: Plugin,P=2.5mm; LCSC Part Number: C2908601; Item Type: Wire To Board Connector
U1 = AMS1117-3.3: SOT-223 Linear Voltage Regulators (LDO) ROHS; Manufacturer: GUOXIN JIAPIN SEMICONDUCTOR; Item Type: IC; Manufacturer Part Number: AMS1117-3.3; Package: SOT-223; LCSC Part Number: C2992570; ComponentLink1Description: LCSC; ComponentLink1URL: https://www.lcsc.com/product-detail/Linear-Voltage-Regulators-LDO_GUOXIN-JIAPIN-SEMICONDUCTOR-AMS1117-3-3_C2992570.html

## Sheet Motor_Encoder_Sheet.SchDoc
size 420 x 297 mm; SheetNumber: 4; SheetTotal: 5
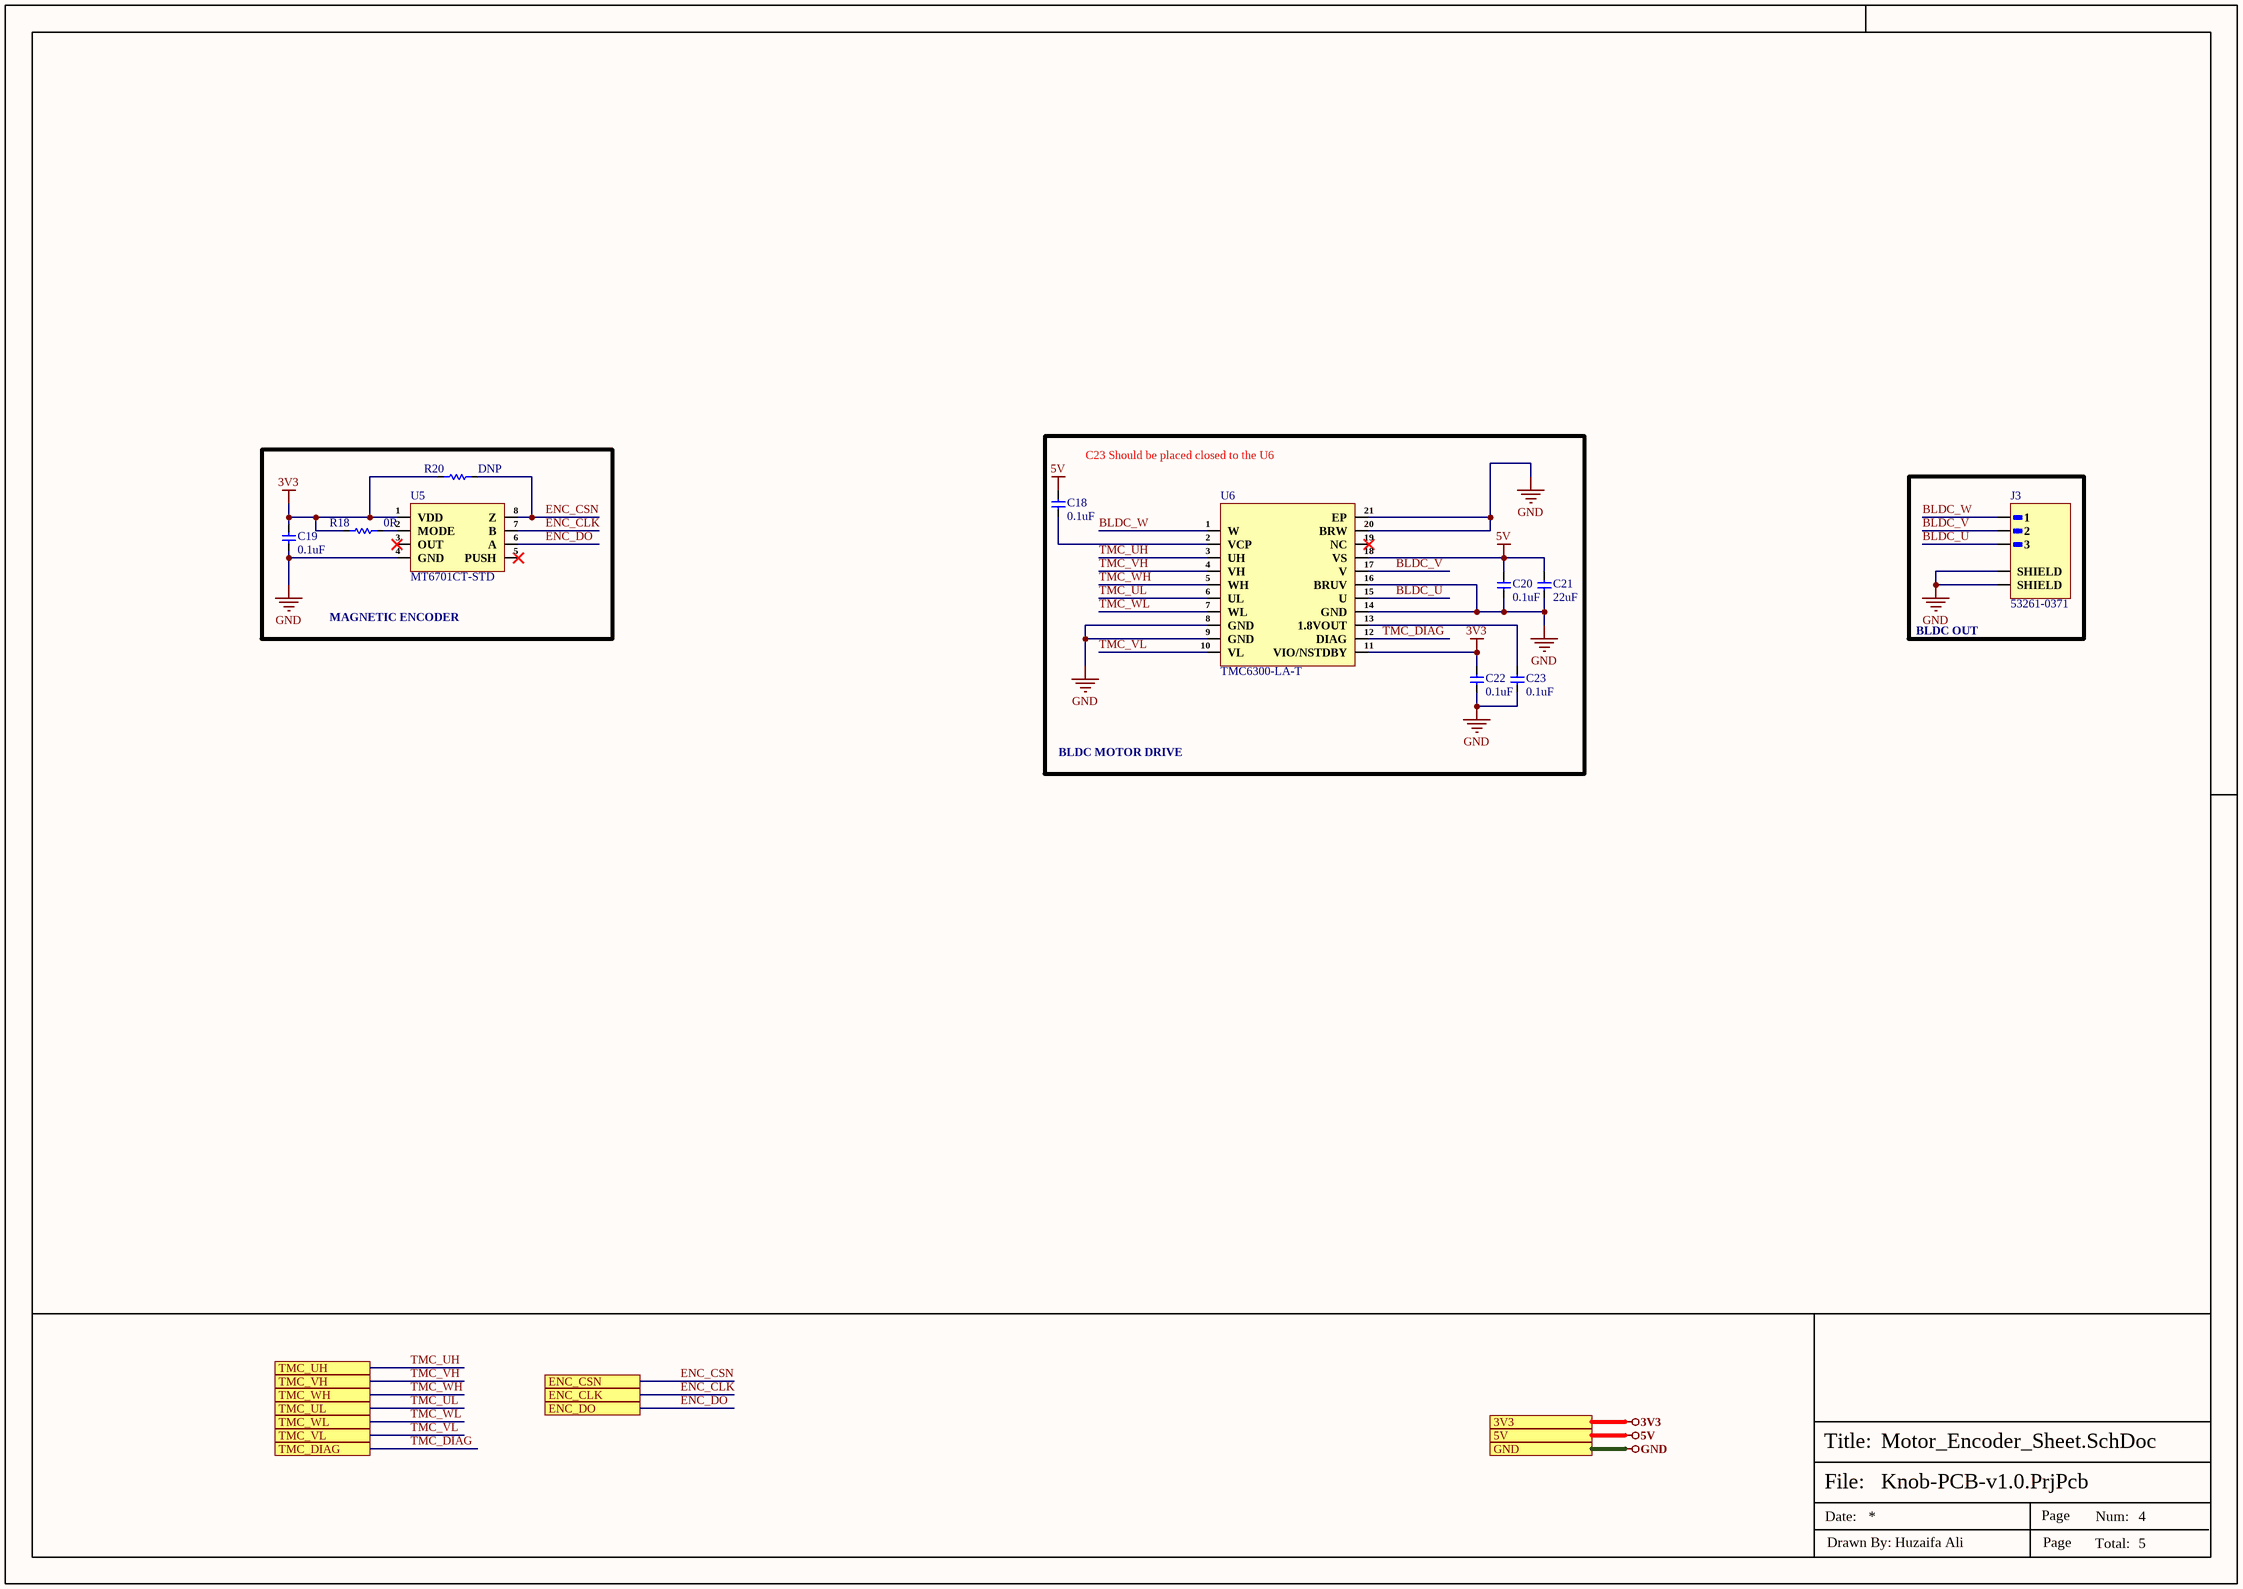
[diagram p3: Motor_Encoder_Sheet.SchDoc]

### Parts
C18  0.1uF  [Cap-0402]
C19  0.1uF  [Cap-0402]
C20  0.1uF  [Cap-0402]
C21  22uF  [Cap-1210]
C22  0.1uF  [Cap-0402]
C23  0.1uF  [Cap-0402]
J3  53261-0371  [53261-0371]
R18  0R  [Res-0603]
R20  DNP  [Res-0603]
U5  MT6701CT-STD  [SOP-8]
U6  TMC6300-LA-T  [20-QFN(3x3)]

### Blocks framed on the sheet
MAGNETIC ENCODER: C19 R18 R20 U5
BLDC OUT: J3

### Ports
3V3 (see Top_Sheet[4B], Controller_Sheet[4D], Power_Sheet[3D], RGB_LED_Sheet[4D]), 5V (see Top_Sheet[4B], Controller_Sheet[4D], Power_Sheet[3D], RGB_LED_Sheet[4D]), ENC_CLK (see Top_Sheet[4C], Controller_Sheet[2D]), ENC_CSN (see Top_Sheet[4C], Controller_Sheet[2D]), ENC_DO (see Top_Sheet[4C], Controller_Sheet[2D]), GND (see Top_Sheet[4B], Controller_Sheet[4D], Power_Sheet[3D], RGB_LED_Sheet[4D]), TMC_DIAG (see Top_Sheet[4B], Controller_Sheet[1D]), TMC_UH (see Top_Sheet[4B], Controller_Sheet[1D]), TMC_UL (see Top_Sheet[4C], Controller_Sheet[1D]), TMC_VH (see Top_Sheet[4B], Controller_Sheet[1D]), TMC_VL (see Top_Sheet[4C], Controller_Sheet[1D]), TMC_WH (see Top_Sheet[4C], Controller_Sheet[1D]), TMC_WL (see Top_Sheet[4C], Controller_Sheet[1D])

### Nets
3V3: C19.2 C22.2 R18.1 R20.1 U5.1(VDD) U6.11(VIO/NSTDBY) ; port 3V3
5V: C18.2 C20.2 C21.2 U6.18(VS) ; port 5V
GND: C19.1 C20.1 C21.1 C22.1 C23.1 J3.SH1(SHIELD) J3.SH2(SHIELD) U5.4(GND) U6.8(GND) U6.9(GND) U6.14(GND) U6.16(BRUV) U6.20(BRW) U6.21(EP) ; port GND
BLDC_U: J3.3 U6.15(U)
BLDC_V: J3.2 U6.17(V)
BLDC_W: J3.1 U6.1(W)
ENC_CLK: U5.7(B) ; port ENC_CLK
ENC_CSN: R20.2 U5.8(Z) ; port ENC_CSN
ENC_DO: U5.6(A) ; port ENC_DO
TMC_DIAG: U6.12(DIAG) ; port TMC_DIAG
TMC_UH: U6.3(UH) ; port TMC_UH
TMC_UL: U6.6(UL) ; port TMC_UL
TMC_VH: U6.4(VH) ; port TMC_VH
TMC_VL: U6.10(VL) ; port TMC_VL
TMC_WH: U6.5(WH) ; port TMC_WH
TMC_WL: U6.7(WL) ; port TMC_WL
NetC18_1: C18.1 U6.2(VCP)
NetC23_2: C23.2 U6.13(1.8VOUT)
NetR18_2: R18.2 U5.2(MODE)

Not connected (* = marked no-connect by the designer): U5 3(OUT)* 5(PUSH)*; U6 19(NC)*

### Notes on the sheet
- C23 Should be placed closed to the U6
- BLDC MOTOR DRIVE
- File:
- Title:
- Date:
- Page
- Num:
- Total:
- Drawn By: Huzaifa Ali

### Library data of the parts
C18-C20 C22 C23 = GRM155R71E104KE14D: as C6 on sheet Controller_Sheet; Supplier: Mouser; LCSC Part Number: C77014; Manufacturer Part Number: GRM155R71E104KE14D; RoHS: Yes; Stock: 652368; Pricing: 1=0.1, 10=0.007, 50=0.007, 100=0.005, 1000=0.005, 10000=0.004 (USD); Mounting Technology: Surface Mount; Case/Package: 0402; Pins: 2NUMBER; Case Code (Metric): 1005; Case Code (Imperial): 0402; Weight: 0.000212oz; Min Operating Temperature: -55°C; Max Operating Temperature: 125°C; Packaging: Tape and Reel; Voltage Rating: 25V; Dielectric: X7R; Voltage: 25V; Termination: SMD/SMT; Voltage Rating (DC): 25V; Package Quantity: 10000; Series: GRM; Length: 1mm; Width: 0.02inch; Height: 0.5mm; Thickness: 0.022inch; Depth: 0.5mm; RoHS Compliant: Yes; Reach SVHC Compliant: Unknown; Lead Free: 5697LeadFree; ComponentLink1URL: http://www.farnell.com/datasheets/1872206.pdf?src-supplier=Farnell; ComponentLink1Description: http://www.farnell.com/datasheets/1872206.pdf?src-supplier=Farnell; ComponentLink2URL: http://www.mouser.com/ds/2/281/c02e-2905.pdf?src-supplier=Mouser; ComponentLink2Description: http://www.mouser.com/ds/2/281/c02e-2905.pdf?src-supplier=Mouser; ComponentLink3URL: http://uk.rs-online.com/webdocs/144c/0900766b8144c113.pdf?src-supplier=Rs; ComponentLink3Description: http://uk.rs-online.com/webdocs/144c/0900766b8144c113.pdf?src-supplier=Rs; ComponentLink4URL: https://datasheet.octopart.com/GRM155R71E104KE14D-Murata-datasheet-62346597.pdf?src-supplier=Future+Electronics; ComponentLink4Description: https://datasheet.octopart.com/GRM155R71E104KE14D-Murata-datasheet-62346597.pdf?src-supplier=Future+Electronics; ComponentLink5URL: https://search.murata.co.jp/Ceramy/image/img/A01X/G101/ENG/GRM155R71E104KE14-01.pdf?src-supplier=Digikey; ComponentLink5Description: https://search.murata.co.jp/Ceramy/image/img/A01X/G101/ENG/GRM155R71E104KE14-01.pdf?src-supplier=Digikey; ComponentLink6URL: http://www.farnell.com/datasheets/2048008.pdf?src-supplier=Newark; ComponentLink6Description: http://www.farnell.com/datasheets/2048008.pdf?src-supplier=Newark; ComponentLink7URL: https://datasheet.octopart.com/GRM155R71E104KE14D-Murata-datasheet-62317124.pdf?src-supplier=Element14; ComponentLink7Description: https://datasheet.octopart.com/GRM155R71E104KE14D-Murata-datasheet-62317124.pdf?src-supplier=Element14; ComponentLink8URL: http://psearch.en.murata.com/capacitor/product/GRM155R71E104KE14%23.pdf?src-supplier=Avnet; ComponentLink8Description: http://psearch.en.murata.com/capacitor/product/GRM155R71E104KE14%23.pdf?src-supplier=Avnet
C21 = GRM32ER71E226KE15L: CAP CER 22UF 25V X7R 1210; Manufacturer: Murata; Item Type: Capacitors; Color: 46Colour; Current Rating: 3A; Gender: 29Gender; Supplier: Mouser; LCSC Part Number: C21397; Manufacturer Part Number: GRM32ER71E226KE15L; RoHS: Yes; Stock: 50822; Pricing: 1=0.78, 10=0.39, 50=0.39, 100=0.351, 1000=0.297, 10000=0.267 (USD); Contact Material: 150ConductorMaterial; Contact Plating: 157ConductorMaterial; Lead Pitch: 2.54mm; Lead Free: 5697LeadFree; ComponentLink1URL: https://datasheet.ciiva.com/16497/product-16497009.pdf?src-supplier=Future+Electronics; ComponentLink1Description: https://datasheet.ciiva.com/16497/product-16497009.pdf?src-supplier=Future+Electronics; ComponentLink2URL: https://datasheet.ciiva.com/6072/1697714-6072768.pdf?src-supplier=Farnell; ComponentLink2Description: https://datasheet.ciiva.com/6072/1697714-6072768.pdf?src-supplier=Farnell; ComponentLink3URL: https://datasheet.ciiva.com/3776/2741grm32er71e226ke1523-3776996.pdf?src-supplier=Arrow+Electronics; ComponentLink3Description: https://datasheet.ciiva.com/3776/2741grm32er71e226ke1523-3776996.pdf?src-supplier=Arrow+Electronics; ComponentLink4URL: https://datasheet.ciiva.com/11789/0900766b80ef921d-11789129.pdf?src-supplier=Rs; ComponentLink4Description: https://datasheet.ciiva.com/11789/0900766b80ef921d-11789129.pdf?src-supplier=Rs; ComponentLink5URL: https://datasheet.ciiva.com/29201/451826-da-01-de-vs-kondens-grm32-er71e-226ke15l-29201795.pdf?src-supplier=Conrad; ComponentLink5Description: https://datasheet.ciiva.com/29201/451826-da-01-de-vs-kondens-grm32-er71e-226ke15l-29201795.pdf?src-supplier=Conrad; ComponentLink6URL: https://datasheet.ciiva.com/22703/1697714-22703397.pdf?src-supplier=Element14; ComponentLink6Description: https://datasheet.ciiva.com/22703/1697714-22703397.pdf?src-supplier=Element14; ComponentLink7URL: https://datasheet.ciiva.com/175/partnumbering-e-01-175746.pdf?src-supplier=Digikey; ComponentLink7Description: https://datasheet.ciiva.com/175/partnumbering-e-01-175746.pdf?src-supplier=Digikey; ComponentLink8URL: https://datasheet.ciiva.com/175/partnumbering-e-01-175747.pdf?src-supplier=Digikey; ComponentLink8Description: https://datasheet.ciiva.com/175/partnumbering-e-01-175747.pdf?src-supplier=Digikey; ComponentLink9URL: https://datasheet.ciiva.com/175/partnumbering-e-01-175748.pdf?src-supplier=Digikey; ComponentLink9Description: https://datasheet.ciiva.com/175/partnumbering-e-01-175748.pdf?src-supplier=Digikey
J3 = 53261-0371: CONN HEADER SMD R/A 3POS 1.25MM; Manufacturer: Molex; Manufacturer Series: 53261; Item Type: Headers and Wire Housings; Plating: Tin; Number of Positions: 3; Gender: Male; Contact Resistance: 20mR; Option: General Purpose; Current Rating: 1A; Voltage Rating: 125V; Mixed Contacts: No; Number of Rows Loaded: 1; Insulation Resistance: 100MR; Number of Circuits: 2; Glow Wire Compliant: Non-compliant; Supplier: Arrow Electronics; LCSC Part Number: C293630; Manufacturer Part Number: 53261-0371; RoHS: Yes; Stock: 442600; Pricing: 1600=0.3964 (USD); Mounting Technology: Surface Mount,Board; Contact Plating: Tin; Contact Material: Bronze,Tin; Color: Natural; Housing Color: Natural; Housing Material: Nylon; Min Operating Temperature: -40°C; Max Operating Temperature: 85°C; Termination: Solder; Orientation: Right Angle; Number of Rows: 1; Packaging: Tape and Reel; Number of Contacts: 3; Series: PicoBlade; Contact Type: Blade Pin; Contact Gender: Male; Mounting Style: STRAIGHT; Filter Feature: No; Voltage Rating (AC): 125V; Working Voltage: 125V; Voltage Rating (DC): 125V; Length: 8.9mm; Pitch: 1.25mm; Depth: 5.2mm; Radiation Hardening: No; Flammability Rating: UL94 V-0; MIL Conformance: No; DIN Conformance: No; IEC Conformance: No; RoHS Compliant: Yes; Reach SVHC Compliant: Unknown; Lead Free: Lead Free; ComponentLink1URL: https://datasheet.ciiva.com/3932/333250532610371-pcb-headers-3932824.pdf?src-supplier=Arrow+Electronics; ComponentLink1Description: https://datasheet.ciiva.com/3932/333250532610371-pcb-headers-3932824.pdf?src-supplier=Arrow+Electronics; ComponentLink2URL: https://datasheet.ciiva.com/34302/1302094-34302177.pdf?src-supplier=Jameco; ComponentLink2Description: https://datasheet.ciiva.com/34302/1302094-34302177.pdf?src-supplier=Jameco
R18 R20 = RC0603JR-070RL: as R1 on sheet Controller_Sheet; Supplier 1: Digi-Key; Manufacturer Part Number: RC0603JR-070RL; RoHS: Yes; Category: Chip SMD Resistors; Stock 1: 18081776; Pricing 1: 1=0.10000, 10=0.01700, 25=0.01240, 50=0.00960, 100=0.00700, 250=0.00536, 500=0.00430, 1000=0.00316 (USD); Case/Package: 0603; Number of Pins: 2; Contact Plating: Tin,Matte; Case Code (Imperial): 0603; Case Code (Metric): 1608; Size Code: 0603; Min Operating Temperature: -55°C; Max Operating Temperature: 155°C; Resistor Type: Thick Film; Packaging: Tape and Reel; Termination: SMD/SMT; Series: RC; Technology: THICK FILM; Package Quantity: 5000; Voltage Rating: 50V; Features: Moisture Resistant; Max Power Dissipation: 100mW; Number of Terminations: 2; Construction: Rectangular; Length: 1.6mm; Width: 0.8mm; Height: 0.45mm; Depth: 0.8mm; Radiation Hardening: No; Reach SVHC Compliant: No SVHC; Lead Free: Lead Free; RoHS Compliant: Yes; Military Standard: Not; Supplier Part Number 1: 311-0.0GRCT-ND; LCSC Part Number: C95177
U5 = MT6701CT-STD: SOP-8 Position Sensors ROHS; Manufacturer: Magn Tek; Item Type: Sensor; Manufacturer Part Number: MT6701CT-STD; Package: SOP-8; LCSC Part Number: C5451785; ComponentLink1Description: LCSC; ComponentLink1URL: https://www.lcsc.com/product-detail/Position-Sensors_Magn-Tek-MT6701CT-STD_C5451785.html?s_z=n_mt6701ct
U6 = TMC6300-LA-T: BLDC MOTOR DRIVER 2-11V QFN20; Manufacturer: Trinamic; Item Type: IC; Supplier: Mouser; LCSC Part Number: C5274455; Manufacturer Part Number: TMC6300-LA-T; RoHS: No; Pricing: 1=3.73, 10=2.47, 50=2.11, 100=1.71, 1000=1.28, 10000=1.15 (USD); Series: -